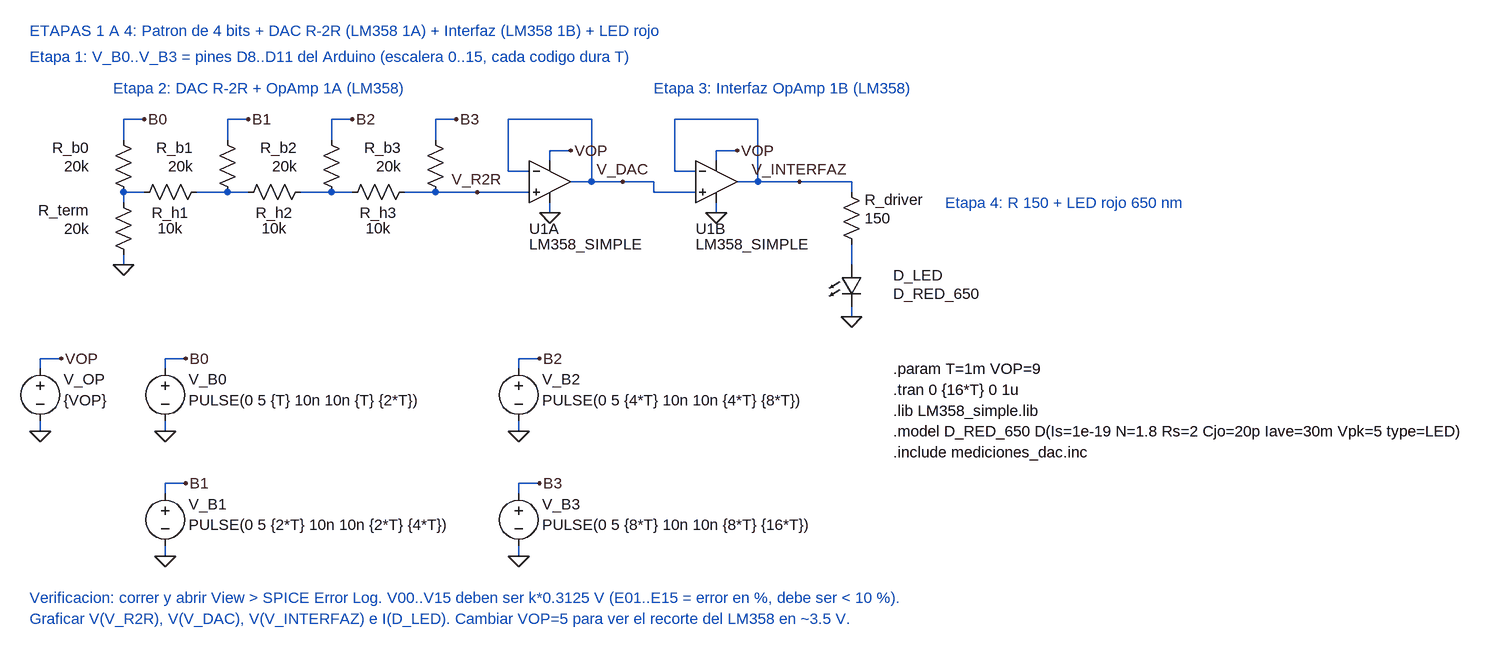
[diagram p0: schematic dac_r2r_buffer.asc]
dac_r2r_buffer.asc, the LTspice schematic file:
Version 4
SHEET 1 2000 1100
WIRE 224 176 256 176
WIRE 384 176 416 176
WIRE 544 176 576 176
WIRE 704 176 736 176
WIRE 816 176 944 176
WIRE 1072 176 1200 176
WIRE 224 176 224 208
WIRE 384 176 384 208
WIRE 544 176 544 208
WIRE 704 176 704 208
WIRE 880 224 912 224
WIRE 1136 224 1168 224
WIRE 880 224 880 240
WIRE 1136 224 1136 240
WIRE 816 176 816 256
WIRE 816 256 848 256
WIRE 1072 176 1072 256
WIRE 1072 256 1104 256
WIRE 944 176 944 272
WIRE 912 272 944 272
WIRE 944 272 1040 272
WIRE 1200 176 1200 272
WIRE 1168 272 1200 272
WIRE 1200 272 1344 272
WIRE 224 288 256 288
WIRE 336 288 384 288
WIRE 384 288 416 288
WIRE 496 288 544 288
WIRE 544 288 576 288
WIRE 656 288 704 288
WIRE 704 288 848 288
WIRE 1040 272 1040 288
WIRE 1040 288 1104 288
WIRE 1344 272 1344 288
WIRE 224 288 224 304
WIRE 880 304 880 320
WIRE 1136 304 1136 320
WIRE 224 384 224 400
WIRE 1344 368 1344 400
WIRE 1344 464 1344 480
WIRE 96 544 128 544
WIRE 288 544 320 544
WIRE 832 544 864 544
WIRE 96 544 96 560
WIRE 288 544 288 560
WIRE 832 544 832 560
WIRE 96 640 96 656
WIRE 288 640 288 656
WIRE 832 640 832 656
WIRE 288 736 320 736
WIRE 832 736 864 736
WIRE 288 736 288 752
WIRE 832 736 832 752
WIRE 288 832 288 848
WIRE 832 832 832 848
FLAG 256 176 B0
FLAG 416 176 B1
FLAG 576 176 B2
FLAG 736 176 B3
FLAG 224 400 0
FLAG 768 288 V_R2R
FLAG 912 224 VOP
FLAG 880 320 0
FLAG 992 272 V_DAC
FLAG 1168 224 VOP
FLAG 1136 320 0
FLAG 1264 272 V_INTERFAZ
FLAG 1344 480 0
FLAG 128 544 VOP
FLAG 96 656 0
FLAG 320 544 B0
FLAG 288 656 0
FLAG 320 736 B1
FLAG 288 848 0
FLAG 864 544 B2
FLAG 832 656 0
FLAG 864 736 B3
FLAG 832 848 0
SYMBOL res 208 192 R0
WINDOW 0 -36 28 Right 2
WINDOW 3 -36 56 Right 2
SYMATTR InstName R_b0
SYMATTR Value 20k
SYMBOL res 368 192 R0
WINDOW 0 -36 28 Right 2
WINDOW 3 -36 56 Right 2
SYMATTR InstName R_b1
SYMATTR Value 20k
SYMBOL res 528 192 R0
WINDOW 0 -36 28 Right 2
WINDOW 3 -36 56 Right 2
SYMATTR InstName R_b2
SYMATTR Value 20k
SYMBOL res 688 192 R0
WINDOW 0 -36 28 Right 2
WINDOW 3 -36 56 Right 2
SYMATTR InstName R_b3
SYMATTR Value 20k
SYMBOL res 352 272 R90
WINDOW 0 32 56 VTop 2
WINDOW 3 56 56 VTop 2
SYMATTR InstName R_h1
SYMATTR Value 10k
SYMBOL res 512 272 R90
WINDOW 0 32 56 VTop 2
WINDOW 3 56 56 VTop 2
SYMATTR InstName R_h2
SYMATTR Value 10k
SYMBOL res 672 272 R90
WINDOW 0 32 56 VTop 2
WINDOW 3 56 56 VTop 2
SYMATTR InstName R_h3
SYMATTR Value 10k
SYMBOL res 208 288 R0
WINDOW 0 -36 28 Right 2
WINDOW 3 -36 56 Right 2
SYMATTR InstName R_term
SYMATTR Value 20k
SYMBOL OpAmps\\opamp2 880 208 R0
WINDOW 0 -32 136 Left 2
WINDOW 3 -32 160 Left 2
SYMATTR InstName U1A
SYMATTR Value LM358_SIMPLE
SYMBOL OpAmps\\opamp2 1136 208 R0
WINDOW 0 -32 136 Left 2
WINDOW 3 -32 160 Left 2
SYMATTR InstName U1B
SYMATTR Value LM358_SIMPLE
SYMBOL res 1328 272 R0
WINDOW 0 36 28 Left 2
WINDOW 3 36 56 Left 2
SYMATTR InstName R_driver
SYMATTR Value 150
SYMBOL LED 1328 400 R0
WINDOW 0 80 16 Left 2
WINDOW 3 80 44 Left 2
SYMATTR InstName D_LED
SYMATTR Value D_RED_650
SYMBOL voltage 96 544 R0
WINDOW 0 36 32 Left 2
WINDOW 3 36 64 Left 2
SYMATTR InstName V_OP
SYMATTR Value {VOP}
SYMBOL voltage 288 544 R0
WINDOW 0 36 32 Left 2
WINDOW 3 36 64 Left 2
SYMATTR InstName V_B0
SYMATTR Value PULSE(0 5 {T} 10n 10n {T} {2*T})
SYMBOL voltage 288 736 R0
WINDOW 0 36 32 Left 2
WINDOW 3 36 64 Left 2
SYMATTR InstName V_B1
SYMATTR Value PULSE(0 5 {2*T} 10n 10n {2*T} {4*T})
SYMBOL voltage 832 544 R0
WINDOW 0 36 32 Left 2
WINDOW 3 36 64 Left 2
SYMATTR InstName V_B2
SYMATTR Value PULSE(0 5 {4*T} 10n 10n {4*T} {8*T})
SYMBOL voltage 832 736 R0
WINDOW 0 36 32 Left 2
WINDOW 3 36 64 Left 2
SYMATTR InstName V_B3
SYMATTR Value PULSE(0 5 {8*T} 10n 10n {8*T} {16*T})
TEXT 80 40 Left 2 ;ETAPAS 1 A 4: Patron de 4 bits + DAC R-2R (LM358 1A) + Interfaz (LM358 1B) + LED rojo
TEXT 80 80 Left 2 ;Etapa 1: V_B0..V_B3 = pines D8..D11 del Arduino (escalera 0..15, cada codigo dura T)
TEXT 208 128 Left 2 ;Etapa 2: DAC R-2R + OpAmp 1A (LM358)
TEXT 1040 128 Left 2 ;Etapa 3: Interfaz OpAmp 1B (LM358)
TEXT 1488 304 Left 2 ;Etapa 4: R 150 + LED rojo 650 nm
TEXT 1408 560 Left 2 !.param T=1m VOP=9
TEXT 1408 592 Left 2 !.tran 0 {16*T} 0 1u
TEXT 1408 624 Left 2 !.lib LM358_simple.lib
TEXT 1408 656 Left 2 !.model D_RED_650 D(Is=1e-19 N=1.8 Rs=2 Cjo=20p Iave=30m Vpk=5 type=LED)
TEXT 1408 688 Left 2 !.include mediciones_dac.inc
TEXT 80 912 Left 2 ;Verificacion: correr y abrir View > SPICE Error Log. V00..V15 deben ser k*0.3125 V (E01..E15 = error en %, debe ser < 10 %).
TEXT 80 944 Left 2 ;Graficar V(V_R2R), V(V_DAC), V(V_INTERFAZ) e I(D_LED). Cambiar VOP=5 para ver el recorte del LM358 en ~3.5 V.

The netlist it stands for:
* dac_r2r_buffer.asc
R_b0 B0 N001 20k
R_b1 B1 N002 20k
R_b2 B2 N003 20k
R_b3 B3 V_R2R 20k
R_h1 N002 N001 10k
R_h2 N003 N002 10k
R_h3 V_R2R N003 10k
R_term N001 0 20k
XU1A V_R2R V_DAC VOP 0 V_DAC LM358_SIMPLE  ; pins In+ In- V+ V- OUT
XU1B V_DAC V_INTERFAZ VOP 0 V_INTERFAZ LM358_SIMPLE  ; pins In+ In- V+ V- OUT
R_driver V_INTERFAZ N004 150
D_LED N004 0 D_RED_650
V_OP VOP 0 {VOP}
V_B0 B0 0 PULSE(0 5 {T} 10n 10n {T} {2*T})
V_B1 B1 0 PULSE(0 5 {2*T} 10n 10n {2*T} {4*T})
V_B2 B2 0 PULSE(0 5 {4*T} 10n 10n {4*T} {8*T})
V_B3 B3 0 PULSE(0 5 {8*T} 10n 10n {8*T} {16*T})
.model D D
.lib standard.dio
* ETAPAS 1 A 4: Patron de 4 bits + DAC R-2R (LM358 1A) + Interfaz (LM358 1B) + LED rojo
* Etapa 1: V_B0..V_B3 = pines D8..D11 del Arduino (escalera 0..15, cada codigo dura T)
* Etapa 2: DAC R-2R + OpAmp 1A (LM358)
* Etapa 3: Interfaz OpAmp 1B (LM358)
* Etapa 4: R 150 + LED rojo 650 nm
.param T=1m VOP=9
.tran 0 {16*T} 0 1u
.lib LM358_simple.lib
.model D_RED_650 D(Is=1e-19 N=1.8 Rs=2 Cjo=20p Iave=30m Vpk=5 type=LED)
.include mediciones_dac.inc
* Verificacion: correr y abrir View > SPICE Error Log. V00..V15 deben ser k*0.3125 V (E01..E15 = error en %, debe ser < 10 %).
* Graficar V(V_R2R), V(V_DAC), V(V_INTERFAZ) e I(D_LED). Cambiar VOP=5 para ver el recorte del LM358 en ~3.5 V.
.backanno
.end